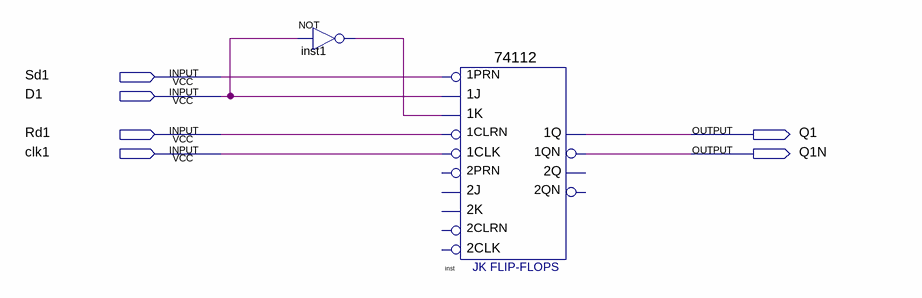
[diagram p0: schematic sheet]
// Quartus schematic exp5_t4_jk2d.bdf as structural Verilog: 2 symbols, 6 pins
module exp5_t4_jk2d (
  input  Sd1,
  input  D1,
  input  Rd1,
  input  clk1,
  output Q1,
  output Q1N
);

  wire inst1_out;

  not inst1 (inst1_out, D1);
  \74112  inst (
    .\1K (inst1_out), .\1J (D1), .\1PRN (Sd1), .\1CLK (clk1), .\1CLRN (Rd1), .\1QN (Q1N), .\1Q (Q1));  // open: 2K, 2J, 2PRN, 2CLK, 2CLRN, 2Q, 2QN
endmodule
